# Altium schematic sheet SENS_MEMS.SchDoc
size A4; DocumentNumber: 3; SheetNumber: 3; SheetTotal: 12
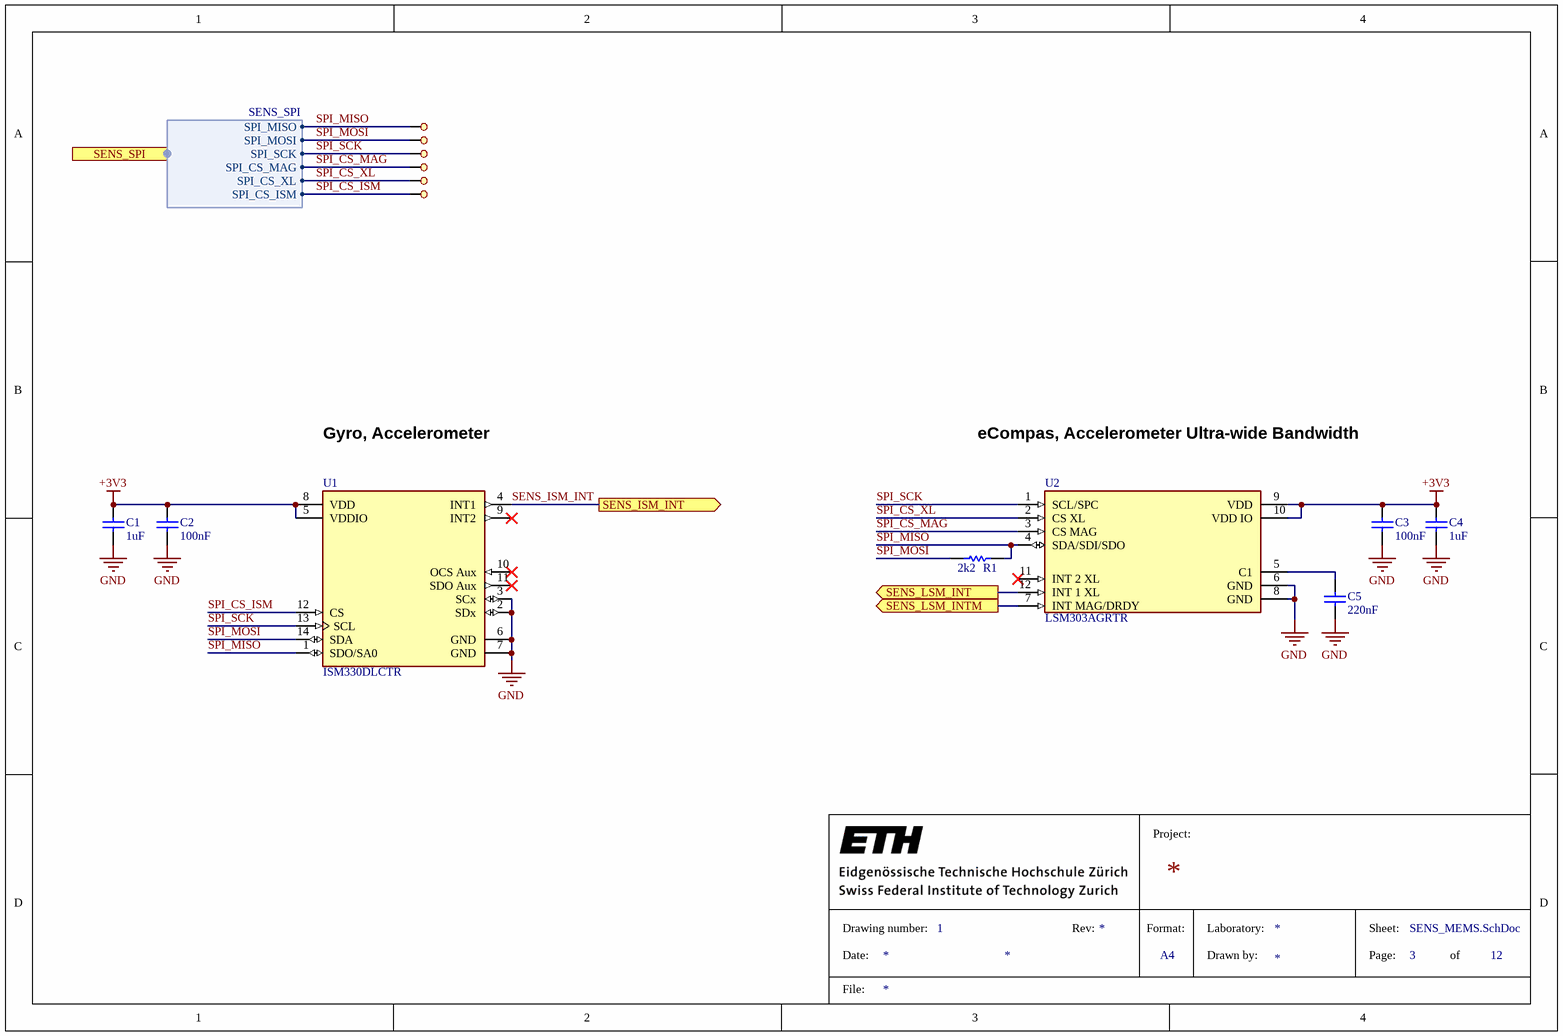
[diagram p0: SENS_MEMS.SchDoc]

## Parts
2  testpoint  [testpoint]  (value not drawn)
3  testpoint  [testpoint]  (value not drawn)
4  testpoint  [testpoint]  (value not drawn)
5  testpoint  [testpoint]  (value not drawn)
6  testpoint  [testpoint]  (value not drawn)
7  testpoint  [testpoint]  (value not drawn)
C1  1uF  [CAPC0402(1005)60_L]
C2  100nF  [CAPC1005X55X25LL05T10]
C3  100nF  [CAPC1005X55X25LL05T10]
C4  1uF  [CAPC0402(1005)60_L]
C5  220nF  [CAPC1005X55X25NL05T05]
R1  2k2  [RESC1005X40X25NL05T10]
U1  ISM330DLCTR  [FP-LGA-14L-DM00249496-MFG]
U2  LSM303AGRTR  [FP-LGA-12-8487206-MFG]

## Ports
SENS_ISM_INT (out, see MAIN[6A], MCU[1B]), SENS_LSM_INT (out, see MAIN[6A], MCU[1B]), SENS_LSM_INTM (out, see MAIN[6A], MCU[1B]), SENS_SPI (harness SENS_SPI, see MAIN[6A], MCU[1B])

## Harnesses
SENS_SPI: SPI_SCK, SPI_MOSI, SPI_MISO, SPI_CS_MAG, SPI_CS_ISM, SPI_CS_XL

## Nets
+3V3: C1.2 C2.2 C3.2 C4.2 U1.5(VDDIO) U1.8(VDD) U2.9(VDD) U2.10(VDD_IO)
GND: C1.1 C2.1 C3.1 C4.1 C5.1 U1.2(SDx) U1.3(SCx) U1.6(GND) U1.7(GND) U2.6(GND) U2.8(GND)
SENS_ISM_INT: U1.4(INT1) ; port SENS_ISM_INT
SENS_LSM_INT: U2.12(INT_1_XL) ; port SENS_LSM_INT
SENS_LSM_INTM: U2.7(INT_MAG/DRDY) ; port SENS_LSM_INTM
SPI_CS_ISM: 7.1 U1.12(CS) ; port SENS_SPI.SPI_CS_ISM
SPI_CS_MAG: 5.1 U2.3(CS_MAG) ; port SENS_SPI.SPI_CS_MAG
SPI_CS_XL: 6.1 U2.2(CS_XL) ; port SENS_SPI.SPI_CS_XL
SPI_MISO: 2.1 R1.2 U1.1(SDO/SA0) U2.4(SDA/SDI/SDO) ; port SENS_SPI.SPI_MISO
SPI_MOSI: 3.1 R1.1 U1.14(SDA) ; port SENS_SPI.SPI_MOSI
SPI_SCK: 4.1 U1.13(SCL) U2.1(SCL/SPC) ; port SENS_SPI.SPI_SCK
NetC5_2: C5.2 U2.5(C1)

Not connected (* = marked no-connect by the designer): U1 9(INT2)* 10(OCS_Aux)* 11(SDO_Aux)*; U2 11(INT_2_XL)*

## Notes on the sheet
- Gyro, Accelerometer
- eCompas, Accelerometer Ultra-wide Bandwidth
- Project:
- Drawing number:
- Date:
- 1
- Rev:
- Format:
- A4
- Laboratory:
- Drawn by:
- Sheet:
- Page:
- of
- File:

## Library data of the parts
C1 C4 = CMP-1034-02114-1: CAP 1uF  0402 (1005 Metric); Manufacturer: Murata; Manufacturer Part Number: GRM155C81C105KE11D; Voltage Rating: 16V; Tolerance: 10%; Dielectric: X6S; Supplier 1: Digi-Key; Supplier Part Number 1: 490-12700-1-ND; RoHS: Yes; Category: Ceramic Capacitors; Stock 1: 7199; Pricing 1: 1=0.29000, 10=0.19700, 50=0.11840, 100=0.09990, 500=0.06836, 1000=0.06047, 2500=0.05784, 5000=0.05258 (USD); Mount: Surface Mount; Case/Package: 0402; Case Code (Metric): 1005; Case Code (Imperial): 0402; Weight: 0.000212oz; Min Operating Temperature: -55°C; Max Operating Temperature: 105°C; Value: 1uF; Packaging: Tape and Reel; Termination: SMD/SMT; Package Quantity: 10000; Voltage Rating (DC): 16V; Resistor Type: Ceramic; Length: 0.039inch; Width: 0.5mm; Height: 0.5mm; Thickness: 0.024inch; RoHS Compliant: Yes; Lead Free: Lead Free; ComponentLink1URL: http://www.mouser.com/ds/2/281/c02e-2905.pdf?src-supplier=Mouser; ComponentLink1Description: http://www.mouser.com/ds/2/281/c02e-2905.pdf?src-supplier=Mouser; ComponentLink2URL: http://search.murata.co.jp/Ceramy/image/img/A01X/G101/ENG/GRM155C81C105KE11-01.pdf?src-supplier=Digi-Key; ComponentLink2Description: http://search.murata.co.jp/Ceramy/image/img/A01X/G101/ENG/GRM155C81C105KE11-01.pdf?src-supplier=Digi-Key
C2 C3 = CMP-2008-03928-1: Manufacturer: Murata; Part Number: GRM155R71C104KA88J; Tolerance: 10%; Value: 100nF; Manufacturer Part Number: GRM155R71C104KA88J
C5 = CMP-1034-02087-2: Manufacturer: Samsung; Manufacturer Part Number: CL05B224KO5NNNC; Material: 4241ConductorMaterial; Tolerance: 10%; Voltage Rating: 16V; Dielectric: X7R; ComponentLink1URL: https://datasheet.ciiva.com/25800/cl05b224ko5nnnc-25800450.pdf?src-supplier=Digikey; ComponentLink1Description: https://datasheet.ciiva.com/25800/cl05b224ko5nnnc-25800450.pdf?src-supplier=Digikey; Supplier: Digikey; Supplier Part Number: 1276-1176-1-ND; RoHS: Yes; Category: Ceramic Capacitors; Stock: 1519601; Pricing: 1=0.1, 10=0.028, 50=0.0164, 100=0.0126, 500=0.0095, 1000=0.00747, 2500=0.00679, 5000=0.00625 (USD); Mounting Technology: Surface Mount; Case/Package: 0402; Case Code (Metric): 1005; Case Code (Imperial): 0402; Min Operating Temperature: -55°C; Max Operating Temperature: 125°C; Packaging: Tape and Reel; Value: 220nF; Series: CL; Voltage Rating (DC): 16V; Construction: Flat; Length: 1mm; Height: 0.5mm; Depth: 0.5mm; Radiation Hardening: No; RoHS Compliant: Yes
R1 = CMP-2002-07567-1: Manufacturer: Yageo / Phycomp; Part Number: RC0402FR-072K2L
U1 = CMP-12177-000014-1: INEMO INERTIAL MODULE: ALWAYS-ON; Manufacturer: STMicroelectronics; Supplier: Digikey; Supplier Part Number: 497-19784-6-ND; Manufacturer Part Number: ISM330DLCTR; RoHS: Yes; Category: Inertial Measurement Units (IMUs); Stock: 20451; Pricing: 1=10.35, 10=8.282, 25=7.6608, 100=6.6256, 500=6.2115, 1000=5.7974 (USD); ComponentLink1URL: https://datasheet.octopart.com/ISM330DHCXTR-STMicroelectronics-datasheet-153441497.pdf?src-supplier=Element14; ComponentLink1Description: https://datasheet.octopart.com/ISM330DHCXTR-STMicroelectronics-datasheet-153441497.pdf?src-supplier=Element14; ComponentLink2URL: https://www.st.com/resource/en/datasheet/ism330dhcx.pdf?src-supplier=Digikey; ComponentLink2Description: https://www.st.com/resource/en/datasheet/ism330dhcx.pdf?src-supplier=Digikey; ComponentLink3URL: https://datasheet.octopart.com/ISM330DHCXTR-STMicroelectronics-datasheet-142139761.pdf?src-supplier=Future+Electronics; ComponentLink3Description: https://datasheet.octopart.com/ISM330DHCXTR-STMicroelectronics-datasheet-142139761.pdf?src-supplier=Future+Electronics
U2 = CMP-2000-07465-2: IMU ACCEL/MAG I2C/SPI 12LGA; Manufacturer: STMicroelectronics; Accel Range: 2/4/8/16g; Operating Supply Current: 3.7-200uA; Sensor Output: I2C,SPI; Accel Resolution: 16bits; Max Supply Voltage: 3.6V; Min Supply Voltage: 1.71V; Mag Sense Range: 49.152gauss (g); Sensor Type: Temperature,Accelerometer,Magnetometer; Mouser Description: IMUs - Inertial Measurement Units Ultra-compact high-performance e-compass 3D accelerometer and 3D magnetometer module; Temperature Range High: +85°C; Package: LGA-12-8487206; Manufacturer Part Number: LSM303AGRTR; Category: IC; Device Class L3: Inertial Measurement Units (IMUs); Temperature: -40°C to +85°C; Device Class L2: Motion Sensors; ComponentLink2Description: Datasheet; Octopart: https://octopart.com/lsm303agrtr-stmicroelectronics-59386630; Automotive: No; Device Class L1: Sensors; Resolution: 16bits; RoHS: TRUE; Height: 1mm; ComponentLink2URL: https://www.st.com/resource/en/datasheet/lsm303agr.pdf; Lead Free: Yes; Temperature Range Low: -40°C; Footprint Url: https://www.st.com/content/ccc/resource/technical/document/technical_note/73/17/9c/16/dd/96/4a/01/CD00134799.pdf/files/CD00134799.pdf/jcr:content/translations/en.CD00134799.pdf; Digikey Description: IMU ACCEL/MAG I2C/SPI 12LGA